# Altium schematic sheet Schematic.SchDoc: PCB BANG TAI
size A4; Date: 21/10; Author: Viet Hoang; DrawnBy: Viet Hoang; SheetNumber: 1; SheetTotal: 1
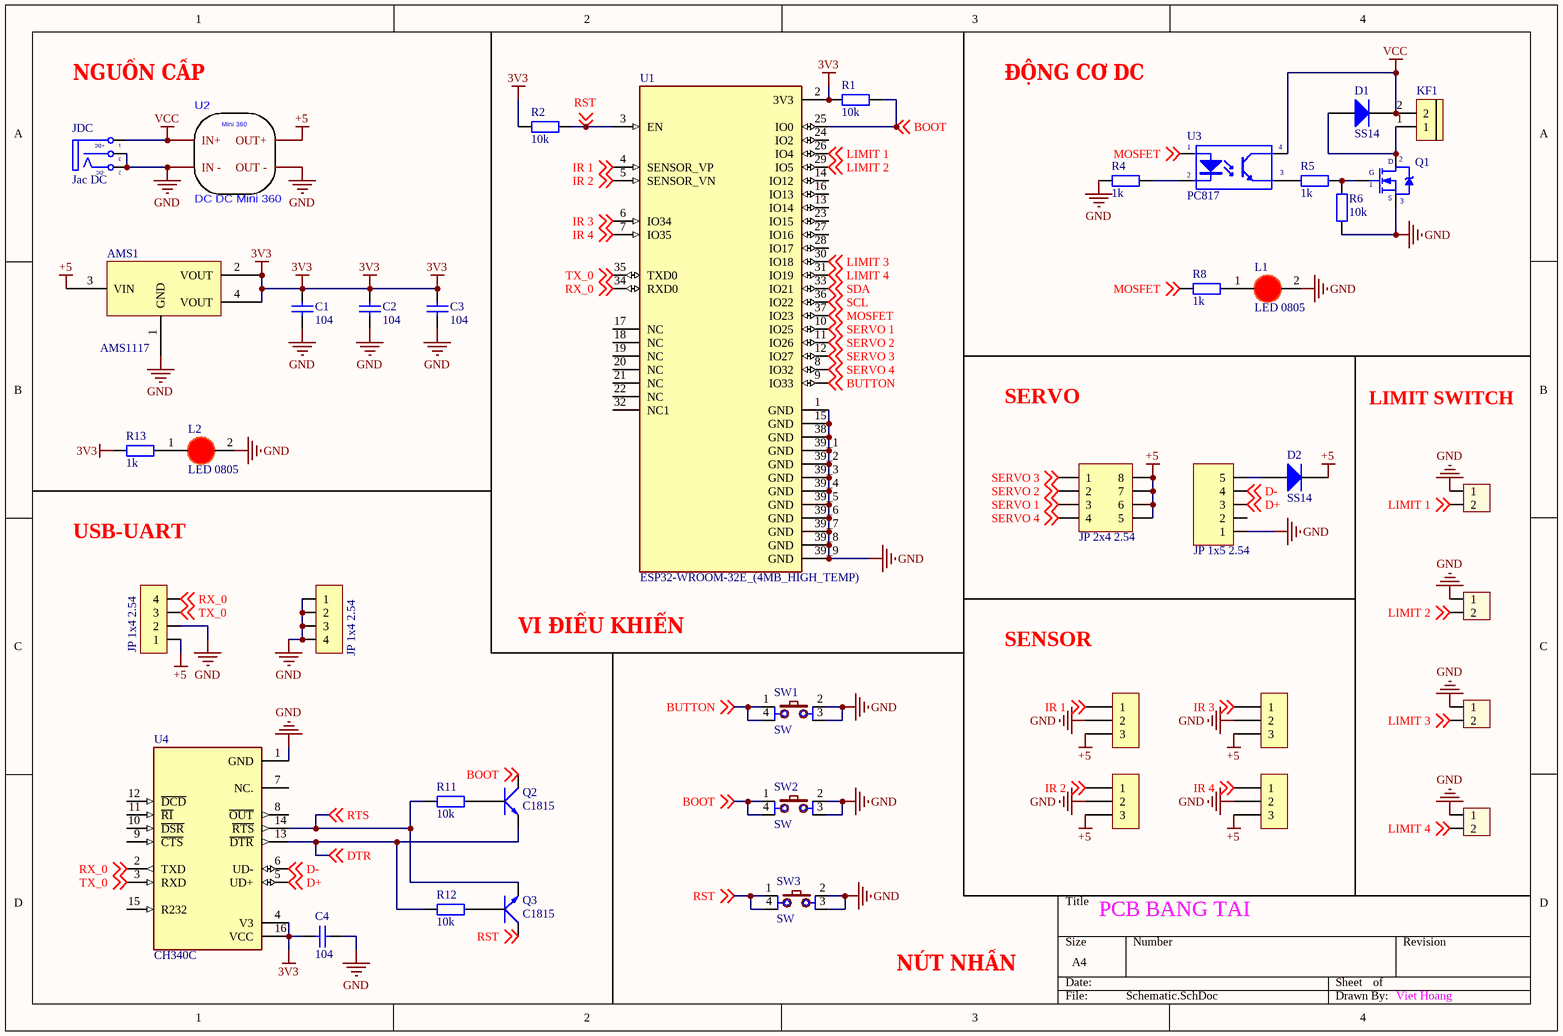
[diagram p0: Schematic.SchDoc]

## Parts
AMS1  AMS1117  [SOT223-4N]
C1  104  [tu 0805]
C2  104  [tu 0805]
C3  104  [tu 0805]
C4  104  [tu 0805]
D1  SS14  [DIODE SMA]
D2  SS14  [DIODE SMA]
H1  Header 2P 2.54 Duc Thang  [XH2.54M-2]  (value not drawn)
H2  Header 2P 2.54 Duc Thang  [XH2.54M-2]  (value not drawn)
H3  Header 2P 2.54 Duc Thang  [XH2.54M-2]  (value not drawn)
H4  Header 2P 2.54 Duc Thang  [XH2.54M-2]  (value not drawn)
H5  Header 3P 2.54 Duc Thang  [XH2.54M-3]  (value not drawn)
H6  Header 3P 2.54 Duc Thang  [XH2.54M-3]  (value not drawn)
H7  Header 3P 2.54 Duc Thang  [XH2.54M-3]  (value not drawn)
H8  Header 3P 2.54 Duc Thang  [XH2.54M-3]  (value not drawn)
JDC  Jac DC  [DC0]
JP1  JP 1x4 2.54  [JP 1x4 DT]
JP2  JP 2x4 2.54  [JP 2x4 DT]
JP3  JP 1x5 2.54  [JP 1x5 DT]
JP4  JP 1x4 2.54  [JP 1x4 DT]
KF1  CON 2 KF301  [Con 2 KF301 5.08]  (value not drawn)
L1  LED 0805  [LED-0805-Red]
L2  LED 0805  [LED-0805-Red]
Q1  IRF3205  [TO252-123]  (value not drawn)
Q2  C1815  [TO92]
Q3  C1815  [TO92]
R1  10k  [tro smd 0805]
R2  10k  [tro smd 0805]
R4  1k  [tro smd 0805]
R5  1k  [tro smd 0805]
R6  10k  [tro smd 0805]
R8  1k  [tro smd 0805]
R11  10k  [tro smd 0805]
R12  10k  [tro smd 0805]
R13  1k  [tro smd 0805]
SW1  SW  [SW2-DIP]
SW2  SW  [SW2-DIP]
SW3  SW  [SW2-DIP]
U1  ESP32-WROOM-32E_(4MB_HIGH_TEMP)  [XCVR_ESP32-WROOM-32E_(4MB_HIGH_TEMP)]
U2  DC DC Mini 360  [DC_DC_MINI360]
U3  PC817  [DIP4/W0.3]
U4  CH340C  [SOIC127P600X180-16N]

## Nets
3V3: AMS1.2(VOUT) AMS1.4(VOUT) C1.1 C2.1 C3.1 C4.2 R1.1 R2.2 R13.2 U1.2(3V3) U4.4(V3) U4.16(VCC)
+5: AMS1.3(VIN) D2.2(K) H5.3 H6.3 H7.3 H8.3 JP2.5 JP2.6 JP2.7 JP2.8 JP4.1 U2.1(OUT+)
GND: AMS1.1(GND) C1.2 C2.2 C3.2 C4.1 H1.1 H2.1 H3.1 H4.1 H5.2 H6.2 H7.2 H8.2 JDC.2(TN) JDC.3(S) JP1.1 JP1.2 JP1.3 JP1.4 JP3.1 JP4.2 L1.2(K) L2.2(K) Q1.3(S) R4.2 R6.1 SW1.2 SW1.3 SW2.2 SW2.3 SW3.2 SW3.3 U1.1(GND) U1.15(GND) U1.38(GND) U1.39_1(GND) U1.39_2(GND) U1.39_3(GND) U1.39_4(GND) U1.39_5(GND) U1.39_6(GND) U1.39_7(GND) U1.39_8(GND) U1.39_9(GND) U2.2(OUT_-) U2.4(IN_-) U4.1(GND)
VCC: D1.2(K) JDC.1(T) KF1.2 U2.3(IN+) U3.4(C)
BOOT: Q2.2(C) R1.2 SW2.1 SW2.4 U1.25(IO0) ; off-sheet BOOT
BUTTON: SW1.1 SW1.4 U1.9(IO33) ; off-sheet BUTTON
D+: JP3.3 U4.5(UD+) ; off-sheet D+
D-: JP3.4 U4.6(UD-) ; off-sheet D-
DTR: Q2.1(E) R12.2 U4.13(~{DTR}) ; off-sheet DTR
IR 1: H5.1 U1.4(SENSOR_VP) ; off-sheet IR 1
IR 2: H7.1 U1.5(SENSOR_VN) ; off-sheet IR 2
IR 3: H6.1 U1.6(IO34) ; off-sheet IR 3
IR 4: H8.1 U1.7(IO35) ; off-sheet IR 4
LIMIT 1: H1.2 U1.26(IO4) ; off-sheet LIMIT 1
LIMIT 2: H2.2 U1.29(IO5) ; off-sheet LIMIT 2
LIMIT 3: H3.2 U1.30(IO18) ; off-sheet LIMIT 3
LIMIT 4: H4.2 U1.31(IO19) ; off-sheet LIMIT 4
MOSFET: R8.2 U1.37(IO23) U3.1(A) ; off-sheet MOSFET
RST: Q3.2(C) R2.1 SW3.1 SW3.4 U1.3(EN) ; off-sheet RST
RTS: Q3.1(E) R11.2 U4.14(~{RTS}) ; off-sheet RTS
RX_0: JP4.4 U1.34(RXD0) U4.2(TXD) ; off-sheet RX_0
SCL: U1.36(IO22) ; off-sheet SCL
SDA: U1.33(IO21) ; off-sheet SDA
SERVO 1: JP2.3 U1.10(IO25) ; off-sheet SERVO 1
SERVO 2: JP2.2 U1.11(IO26) ; off-sheet SERVO 2
SERVO 3: JP2.1 U1.12(IO27) ; off-sheet SERVO 3
SERVO 4: JP2.4 U1.8(IO32) ; off-sheet SERVO 4
TX_0: JP4.3 U1.35(TXD0) U4.3(RXD) ; off-sheet TX_0
NetD1_1: D1.1(A) KF1.1 Q1.2(D)
NetD2_1: D2.1(A) JP3.5
NetL1_1: L1.1(A) R8.1
NetL2_1: L2.1(A) R13.1
NetQ1_1: Q1.1(G) R5.1 R6.2
NetQ2_3: Q2.3(B) R11.1
NetQ3_3: Q3.3(B) R12.1
NetR4_1: R4.1 U3.2(K)
NetR5_2: R5.2 U3.3(E)

Not connected (* = marked no-connect by the designer): JP3 2; U1 13(IO14) 14(IO12) 16(IO13) 17(NC) 18(NC) 19(NC) 20(NC) 21(NC) 22(NC) 23(IO15) 24(IO2) 27(IO16) 28(IO17) 32(NC1); U4 7(NC.) 8(~{OUT}) 9(~{CTS}) 10(~{DSR}) 11(~{RI}) 12(~{DCD}) 15(R232)

## Notes on the sheet
- NGUỒN CẤP
- ĐỘNG CƠ DC
- SERVO
- LIMIT SWITCH
- USB-UART
- VI ĐIỀU KHIỂN
- SENSOR
- NÚT NHẤN
- (in symbol DC DC Mini 360) Mini 360
- (in symbol DCIN) +DC; -DC

## Library data of the parts
AMS1 = AMS1117: AMS
C1-C4 = Tu 0805 104 50V 10%: Dán; Don_Vi: Con; So_Chan: 2; Ten_Linh_Kien: Tụ 0805 104-100nF 10% 50V; Ma_Hang: MH004551; Chung_Loai: Dán; Kieu_Chan: *
D1 D2 = Diode SS14 ( 1N5819): Dán; Ma_Hang: MH002211; Don_Vi: Con; Ten_Linh_Kien: Diode SS14 DO214 Schottky 1A 40V ( 1N5819 DO214); Chung_Loai: Dán; Ghi_Chu: *; Kieu_Chan: *
H1-H4 = Header 2P 2.54 Duc Thang: Cắm; Ten_Linh_Kien: Header 2P XH2.54-2P Đực Thẳng; Don_Vi: Con; Ma_Hang: MH001283; Chung_Loai: Cắm
H5-H8 = Header 3P 2.54 Duc Thang: Cắm; Ten_Linh_Kien: Header 3P XH2.54-3P Đực Thẳng; Don_Vi: Con; Ma_Hang: MH001292; Chung_Loai: Cắm
JDC = DCIN: Jac DC input; Value: Jac DC
JP1 JP4 = JP 1x4 2.54 Duc Thang: Cắm; Ten_Linh_Kien: Jump Đơn Đực 2.54MM 1x40P Thẳng 11MM; Don_Vi: Con; Ma_Hang: MH000903; Ghi_Chu: *; Kieu_Chan: *; Chung_Loai: Cắm
JP2 = JP 2x4 2.54 Duc Thang: Cắm; Ten_Linh_Kien: Jump Đôi Đực 2.54MM 2x40P Thẳng 11MM; Don_Vi: Con; Ma_Hang: MH002686; Ghi_Chu: *; Kieu_Chan: *; Chung_Loai: Cắm
JP3 = JP 1x5 2.54 Duc Thang: Cắm; Ten_Linh_Kien: Jump Đơn Đực 2.54MM 1x40P Thẳng 11MM; Don_Vi: Con; Ma_Hang: MH000903; Ghi_Chu: *; Kieu_Chan: *; Chung_Loai: Cắm
KF1 = CON 2 KF301: Cắm; Ma_Hang: MH000987; Ten_Linh_Kien: CON 2 KF301-2P 5.08MM Xanh Dương; Chung_Loai: Cắm; Ghi_Chu: *; Kieu_Chan: *; Don_Vi: Con
L1 L2 = LED 0805 Do: Dán; Don_Vi: Con; Ma_Hang: MH000897; Ten_Linh_Kien: LED 0805 Màu Đỏ (Red); Ghi_Chu: *; Kieu_Chan: *; Chung_Loai: Dán
Q2 Q3 = C1815: NPN transistor; Value: C9014
R1 R2 R6 R11 R12 = Tro 0805 5% 10k: Dán; Don_Vi: Con; So_Chan: 2; Ten_Linh_Kien: Trở 0805 5% 10k; Ma_Hang: MH005239; Chung_Loai: Dán; Kieu_Chan: *
R4 R5 R8 R13 = Tro 0805 1% 5.1k: Dán; Don_Vi: Con; So_Chan: 2; Ten_Linh_Kien: Trở 0805 1% 5.1k; Ma_Hang: MH008812; Chung_Loai: Dán; Kieu_Chan: *
SW1-SW3 = SW4: Switch button 4 pin; Value: Button chip 4 pin
U1 = ESP32-WROOM-32E_(4MB_HIGH_TEMP): Bluetooth, WiFi 802.11b/g/n, Bluetooth v4.2 +EDR, Class 1, 2 and 3 Transceiver Module 2.4GHz ~ 2.5GHz Integrated, Trace Surface Mount; MF: Espressif Systems; MP: ESP32-WROOM-32E (4MB HIGH TEMP); Package: SMD-44 Espressif Systems; Check_prices: https://www.snapeda.com/parts/ESP32-WROOM-32E%20(4MB%20HIGH%20TEMP)/Espressif+Systems/view-part/?ref=eda; Value: *; Price: None; Purchase-URL: https://pricing.snapeda.com/search/part/ESP32-WROOM-32E (4MB HIGH TEMP)/?ref=eda; SnapEDA_Link: https://www.snapeda.com/parts/ESP32-WROOM-32E%20(4MB%20HIGH%20TEMP)/Espressif+Systems/view-part/?ref=snap; Availability: In Stock
U3 = PC817: Single Opto; Value: PC817
U4 = CH340C: USB to serial chip CH340; MF: WCH; Price: None; Availability: Not in stock; MP: CH340C; Package: None; SnapEDA_Link: https://www.snapeda.com/parts/CH340C/WCH/view-part/?ref=snap; Check_prices: https://www.snapeda.com/parts/CH340C/WCH/view-part/?ref=eda; Value: *